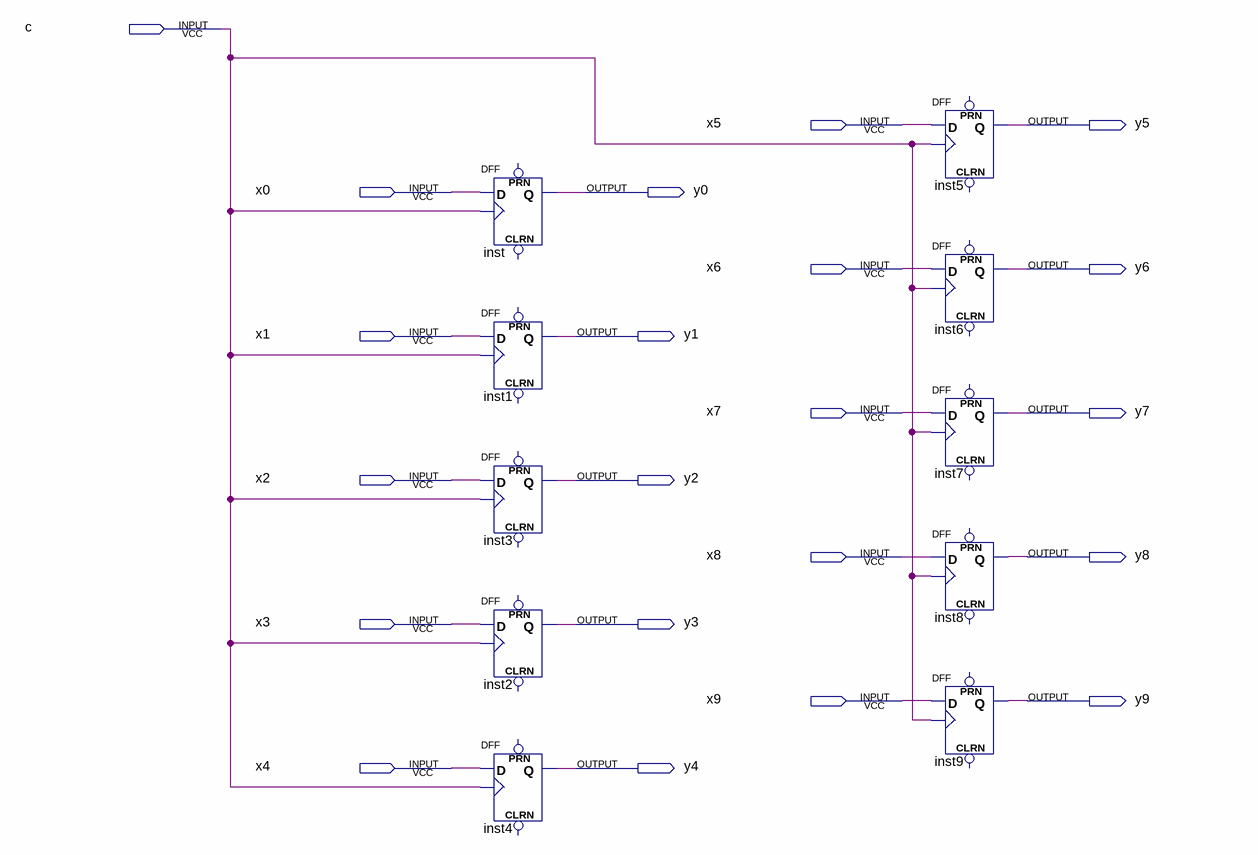
[diagram p0: schematic sheet]
// Quartus schematic SiFOVM_lab1.bdf as structural Verilog: 10 symbols, 21 pins
module SiFOVM_lab1 (
  input  c,
  input  x5,
  input  x0,
  input  x6,
  input  x1,
  input  x7,
  input  x2,
  input  x8,
  input  x3,
  input  x9,
  input  x4,
  output y5,
  output y0,
  output y6,
  output y1,
  output y7,
  output y2,
  output y8,
  output y3,
  output y9,
  output y4
);

  DFF inst (.CLK(c), .D(x0), .Q(y0));  // open: CLRN, PRN
  DFF inst1 (.CLK(c), .D(x1), .Q(y1));  // open: CLRN, PRN
  DFF inst3 (.CLK(c), .D(x2), .Q(y2));  // open: CLRN, PRN
  DFF inst2 (.CLK(c), .D(x3), .Q(y3));  // open: CLRN, PRN
  DFF inst4 (.CLK(c), .D(x4), .Q(y4));  // open: CLRN, PRN
  DFF inst5 (.CLK(c), .D(x5), .Q(y5));  // open: CLRN, PRN
  DFF inst6 (.CLK(c), .D(x6), .Q(y6));  // open: CLRN, PRN
  DFF inst7 (.CLK(c), .D(x7), .Q(y7));  // open: CLRN, PRN
  DFF inst8 (.CLK(c), .D(x8), .Q(y8));  // open: CLRN, PRN
  DFF inst9 (.CLK(c), .D(x9), .Q(y9));  // open: CLRN, PRN
endmodule
